# Altium schematic sheet Sheet3.SchDoc
size A; SheetNumber: 3; SheetTotal: 7
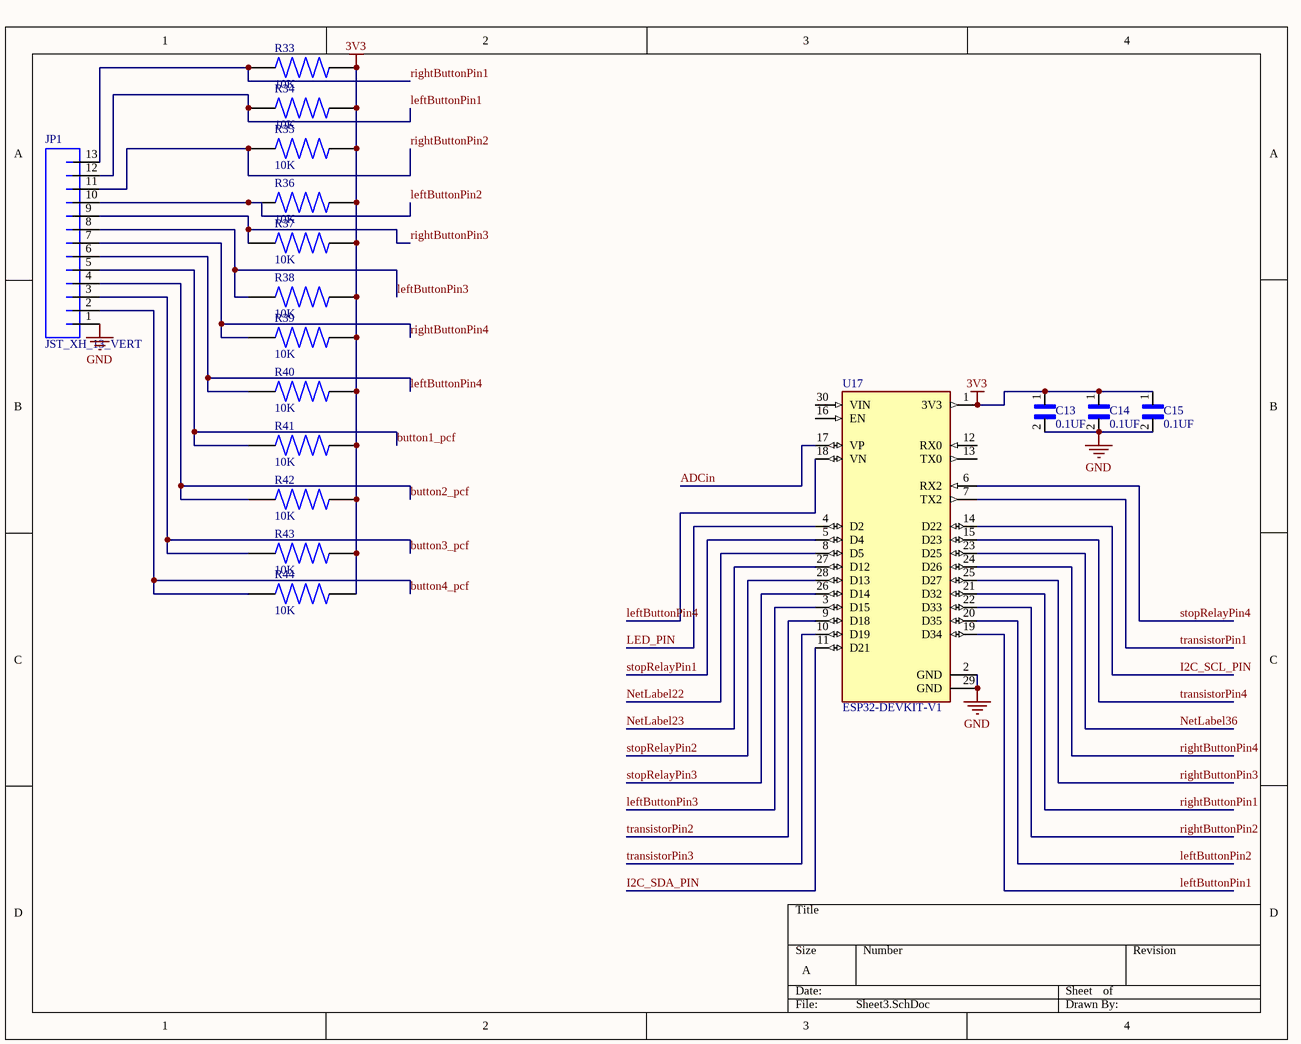
[diagram p0: Sheet3.SchDoc]

## Parts
C13  0.1UF  [CAPC2012X135N]
C14  0.1UF  [CAPC2012X135N]
C15  0.1UF  [CAPC2012X135N]
JP1  JST_XH_13_VERT  [JST-XH-13-PTH-VERT]
R33  10K  [RESC2012X65N]
R34  10K  [RESC2012X65N]
R35  10K  [RESC2012X65N]
R36  10K  [RESC2012X65N]
R37  10K  [RESC2012X65N]
R38  10K  [RESC2012X65N]
R39  10K  [RESC2012X65N]
R40  10K  [RESC2012X65N]
R41  10K  [RESC2012X65N]
R42  10K  [RESC2012X65N]
R43  10K  [RESC2012X65N]
R44  10K  [RESC2012X65N]
U17  ESP32-DEVKIT-V1  [MODULE_ESP32_DEVKIT_V1]

## Nets
3V3: C13.1 C14.1 C15.1 R33.2 R34.2 R35.2 R36.2 R37.2 R38.2 R39.2 R40.2 R41.2 R42.2 R43.2 R44.2 U17.1(3V3)
GND: C13.2 C14.2 C15.2 JP1.1 U17.2(GND) U17.29(GND)
ADCin: U17.17(VP)
button1_pcf: JP1.5 R41.1
button2_pcf: JP1.4 R42.1
button3_pcf: JP1.3 R43.1
button4_pcf: JP1.2 R44.1
I2C_SCL_PIN: U17.14(D22)
I2C_SDA_PIN: U17.11(D21)
LED_PIN: U17.4(D2)
leftButtonPin1: JP1.12 R34.1 U17.19(D34)
leftButtonPin2: JP1.10 R36.1 U17.20(D35)
leftButtonPin3: JP1.8 R38.1 U17.3(D15)
leftButtonPin4: JP1.6 R40.1 U17.18(VN)
NetLabel22: U17.8(D5)
NetLabel23: U17.27(D12)
NetLabel36: U17.23(D25)
rightButtonPin1: JP1.13 R33.1 U17.21(D32)
rightButtonPin2: JP1.11 R35.1 U17.22(D33)
rightButtonPin3: JP1.9 R37.1 U17.25(D27)
rightButtonPin4: JP1.7 R39.1 U17.24(D26)
stopRelayPin1: U17.5(D4)
stopRelayPin2: U17.28(D13)
stopRelayPin3: U17.26(D14)
stopRelayPin4: U17.6(RX2)
transistorPin1: U17.7(TX2)
transistorPin2: U17.9(D18)
transistorPin3: U17.10(D19)
transistorPin4: U17.15(D23)

Not connected (* = marked no-connect by the designer): U17 12(RX0) 13(TX0) 16(EN) 30(VIN)

## Library data of the parts
C13-C15 = GCM2165C2A151JA16D: Cap Ceramic 150pF 100V C0G 5% Pad SMD 0805 125Â°C Automotive T/R; Package: None; Price: None; Value: *; MP: GCM2165C2A151JA16D; Availability: Unavailable
JP1 = JST_XH_13_VERT: Manufacturer: JST Sales America, Inc.; PartNumber: B13B-XH-A(LF)(SN); Mounting Technology: Through Hole; PackageReference: JST-XH
R33-R44 = RN73C2A3K3BTDF: TE; IND Devices; Resistors; RN 0805 3K3 0.1% 10PPM 1K RL | TE Connectivity RN73C2A3K3BTDF; Power_Rating: .1 W; Resistance: 3.3K; Voltage_Rating: 100 V; Tolerance: .1%; SnapEDA_Link: https://www.snapeda.com/parts/RN73C2A3K3BTDF/TE+Connectivity/view-part/?ref=snap; Package: 0805; Value: *; MF: TE Connectivity; MP: RN73C2A3K3BTDF; EU_RoHS_Compliance: Compliant; Check_prices: https://www.snapeda.com/parts/RN73C2A3K3BTDF/TE+Connectivity/view-part/?ref=eda
U17 = ESP32-DEVKIT-V1: Dual core, Wi-Fi: 2.4 GHz up to 150 Mbits/s,BLE (Bluetooth Low Energy) and legacy Bluetooth, 32 bits, Up to 240 MHz; MF: Do it; SnapEDA_Link: https://www.snapeda.com/parts/ESP32-DEVKIT-V1/Do+it/view-part/?ref=snap; Package: None; Value: *; MP: ESP32-DEVKIT-V1; Check_prices: https://www.snapeda.com/parts/ESP32-DEVKIT-V1/Do+it/view-part/?ref=eda